# EasyEDA Pro project C8T6v1.eprj, schematic Schematic1
Board Name: PCB2; Create Date: 2026-07-18; Page Name: P1; Project Name: 12; Schematic Name: Schematic1; Update Date: 2026-07-18; Company: 嘉立创EDA; Page Size: A4; Version: V1.0
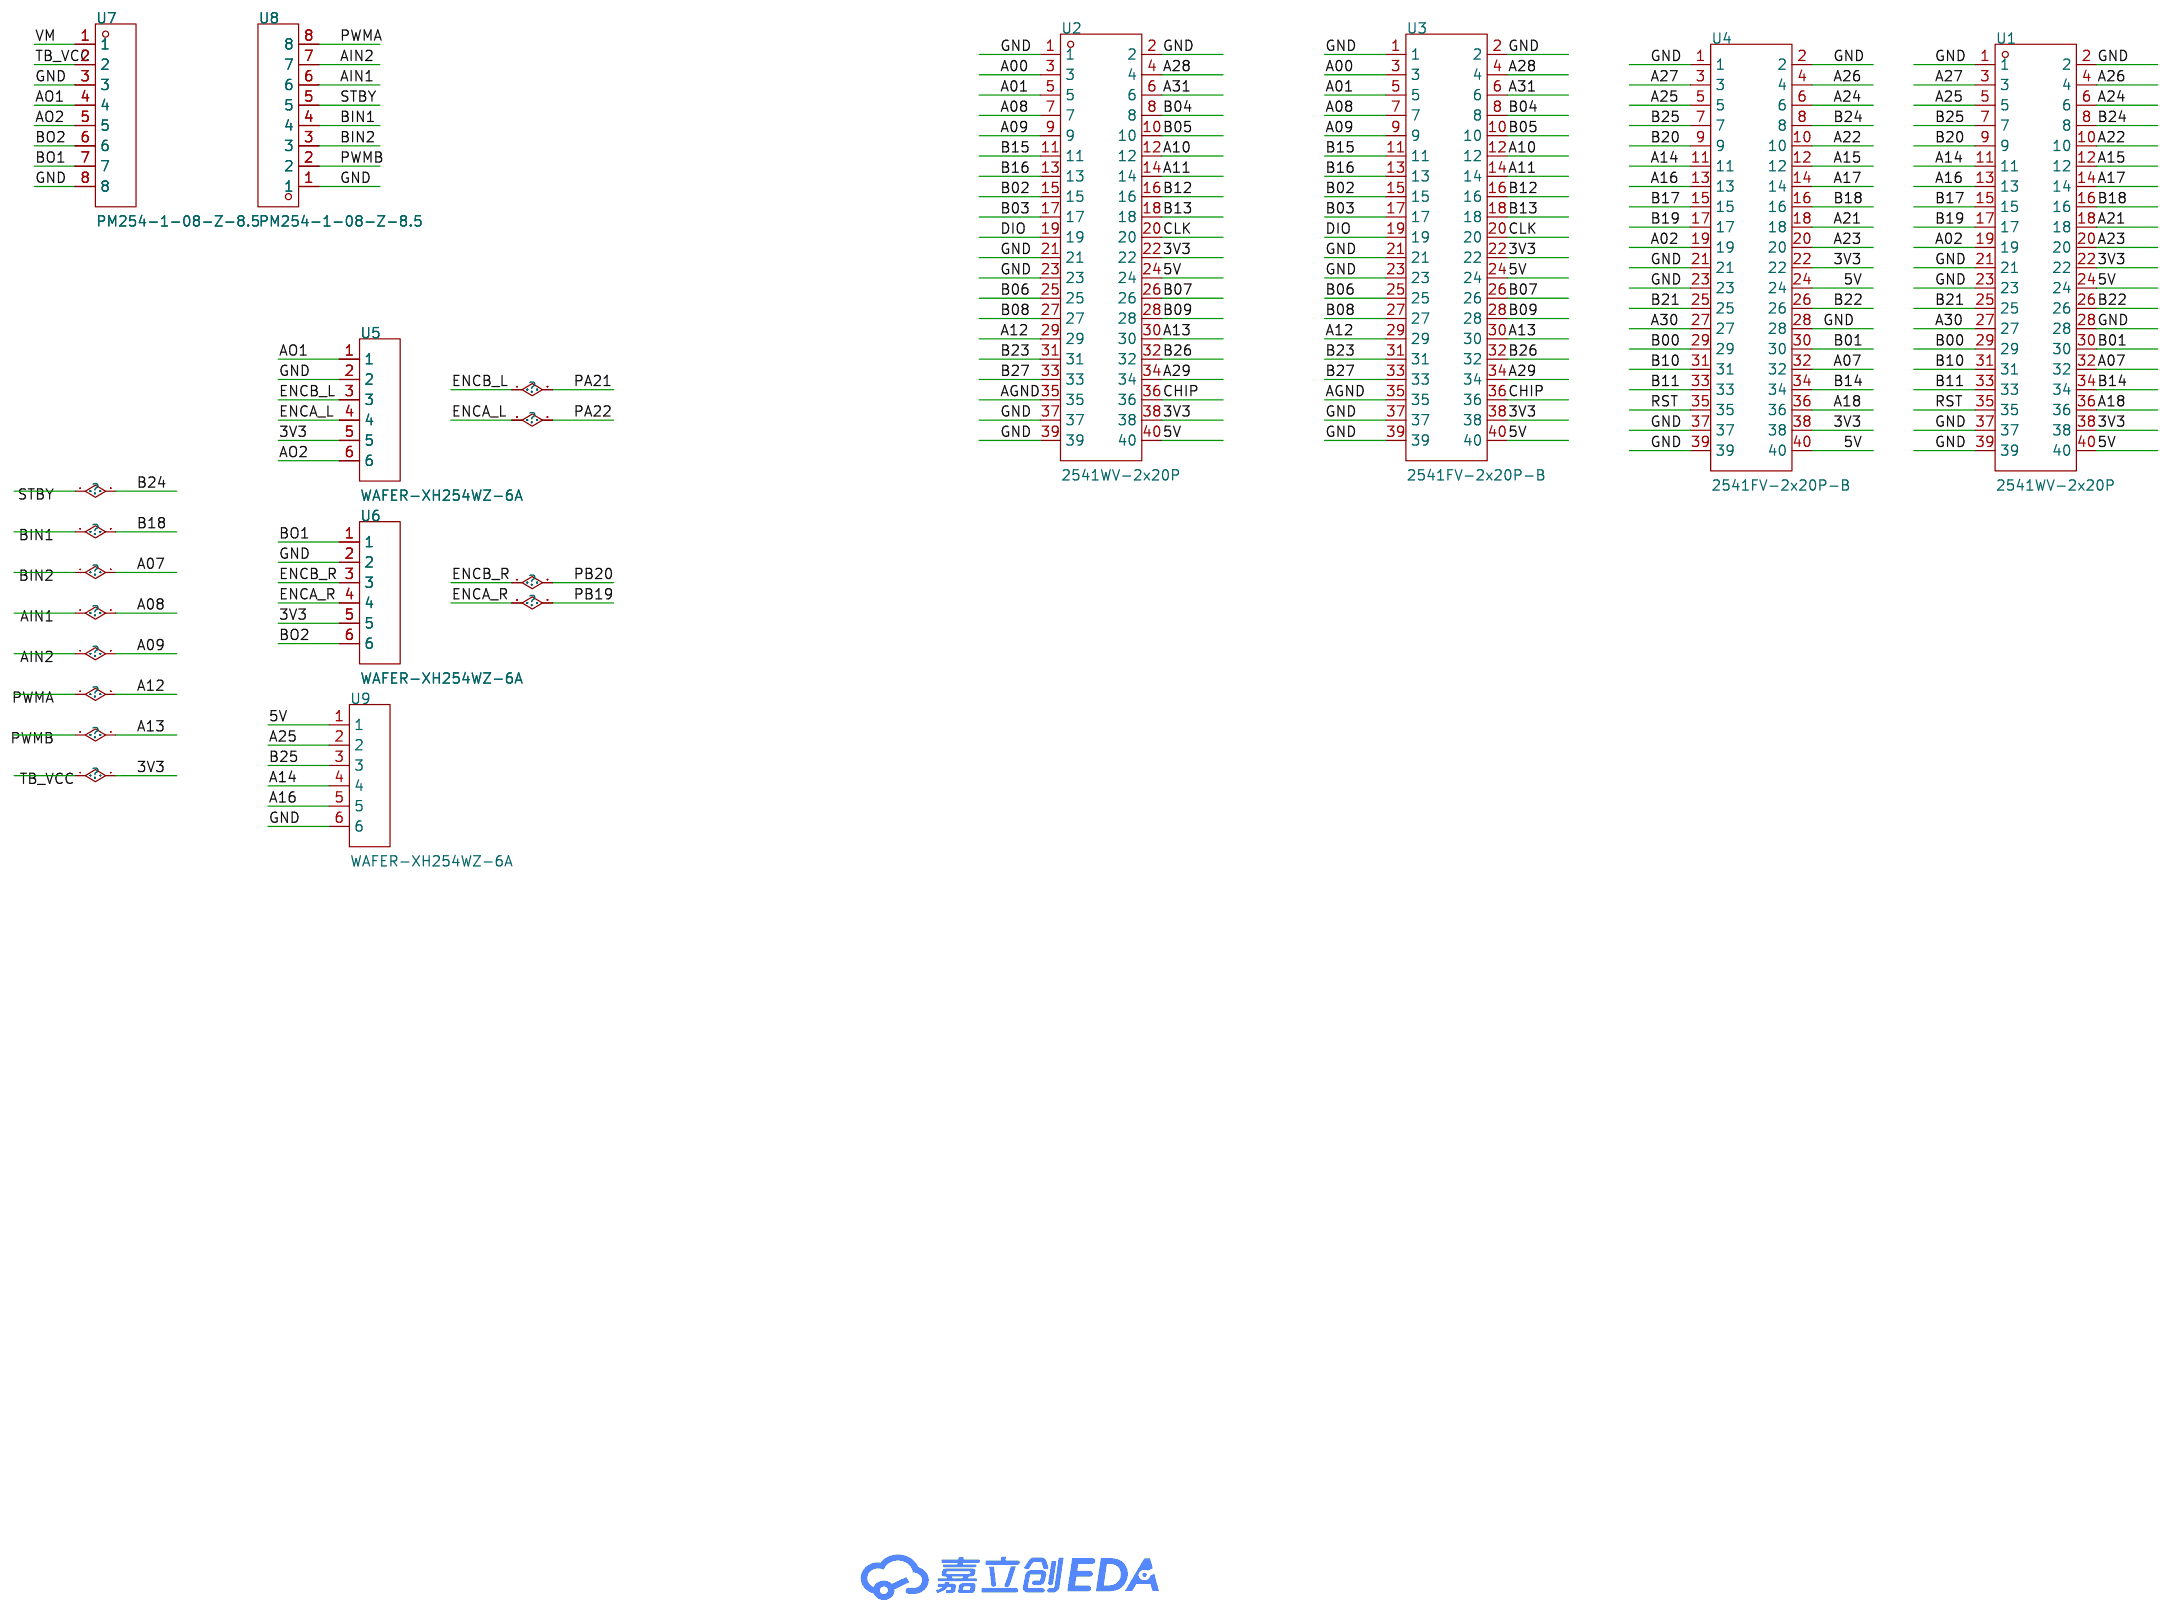
[diagram p0: schematic sheet]

## Parts
U1  2541WV-2x20P  [HDR-TH_40P-P2.54-V-M-R2-C20-S2.54]
U2  2541WV-2x20P  [HDR-TH_40P-P2.54-V-M-R2-C20-S2.54]
U3  2541FV-2x20P-B  [HDR-TH_40P-P2.54-V-F-R2-C20-S2.54]
U4  2541FV-2x20P-B  [HDR-TH_40P-P2.54-V-F-R2-C20-S2.54]
U5  WAFER-XH254WZ-6A  [CONN-TH_6P-P2.50_WAFER-XH254WZ-6A]
U6  WAFER-XH254WZ-6A  [CONN-TH_6P-P2.50_WAFER-XH254WZ-6A]
U7  PM254-1-08-Z-8.5  [HDR-TH_8P-P2.54-V-F]
U8  PM254-1-08-Z-8.5  [HDR-TH_8P-P2.54-V-F]
U9  WAFER-XH254WZ-6A  [CONN-TH_6P-P2.50_WAFER-XH254WZ-6A]

## Library data of the parts
U1 U2 = 2541WV-2x20P: LCSC Part Name: 2x20P 间距:2.54mm 方针 直插; Supplier Part: C25503140; Manufacturer: HanElectricity(瀚源); Supplier Footprint: 插件,P=2.54mm; JLCPCB Part Class: 扩展库; Datasheet: https://item.szlcsc.com/datasheet/2541WV-2x20P/27233683.html; Supplier: LCSC; Pin Structure: 2x20P; Pitch: 2.54mm; Row Spacing: 2.54mm; Circluar Pins/Square Pins: 方针; Mounting Type: 直插; Number of Rows: 双排; Number of Pins: 40P; Current Rating: 3A; Length of Mating Pin: 6mm; Insulation Height: 2.54mm; Length of End Connection Pin: 3mm; Contact Material: 黄铜; Contact Plating: 金; Operating Temperature: -55℃~+105℃
U3 U4 = 2541FV-2x20P-B: LCSC Part Name: 2x20P 间距:2.54mm 直插; Supplier Part: C25503128; Manufacturer: HanElectricity(瀚源); Supplier Footprint: 插件,P=2.54mm; JLCPCB Part Class: 扩展库; Datasheet: https://item.szlcsc.com/datasheet/2541FV-2x20P-B/27233671.html; Supplier: LCSC; Holes Structure: 2x20P; Pitch: 2.54mm; Row Spacing: 2.54mm; Circular Hole / Square Hole: 方孔; Mounting Type: 直插; Number of Rows: 双排; Number of Positions: 40P; Current Rating: 3A; Holes Direction: 顶部; Operating Temperature: -40℃~+105℃
U5 U6 U9 = WAFER-XH254WZ-6A: LCSC Part Name: 1x6P 间距:2.54mm 弯插 系列:XH; Supplier Part: C7432695; Manufacturer: HANBO(汉博); Supplier Footprint: 插件,P=2.5mm; JLCPCB Part Class: 扩展库; Datasheet: https://item.szlcsc.com/datasheet/WAFER-XH254WZ-6A/8437692.html; Supplier: LCSC; Pins Structure: 1x6P; Pitch: 2.54mm; Mounting Type: 弯插; Reference Series: XH; Number of Pins: 6P; Number of Rows: 1; Number of PINs Per Row: 6; Current Rating: 3A; Contact Material: 黄铜; Operating Temperature: -25℃~+85℃; Voltage Rating: 250V; Plastic Material: PA66; Flame Retardant Rating: UL94V-0
U7 U8 = PM254-1-08-Z-8.5: LCSC Part Name: 1x8P 间距:2.54mm 直插; Supplier Part: C2897371; Manufacturer: HCTL(华灿天禄); Supplier Footprint: 插件,P=2.54mm; JLCPCB Part Class: 扩展库; Datasheet: https://item.szlcsc.com/datasheet/PM254-1-08-Z-8.5/3142376.html; Supplier: LCSC; Holes Structure: 1x8P; Pitch: 2.54mm; Circular Hole / Square Hole: 方孔; Mounting Type: 直插; Number of Rows: 单排; Number of Positions: 8P; Current Rating: 3A; Holes Direction: 顶部; Insulation Height: 8.5mm; Contact Material: 铜合金; Operating Temperature: -40℃~+105℃

## Nets
3V3: U1.22 U1.38 U2.22 U2.38 U3.22 U3.38 U4.22 U4.38 U5.5 U6.5 U7.2
5V: U1.24 U1.40 U2.24 U2.40 U3.24 U3.40 U4.24 U4.40 U9.1
AGND: U2.35 U3.35
GND: U1.1 U1.2 U1.21 U1.23 U1.28 U1.37 U1.39 U2.1 U2.2 U2.21 U2.23 U2.37 U2.39 U3.1 U3.2 U3.21 U3.23 U3.37 U3.39 U4.1 U4.2 U4.21 U4.23 U4.28 U4.37 U4.39 U5.2 U6.2 U7.3 U7.8 U8.1 U9.6
A00: U2.3 U3.3
A01: U2.5 U3.5
A02: U1.19 U4.19
A07: U1.32 U4.32 U8.3
A08: U2.7 U3.7 U8.6
A09: U2.9 U3.9 U8.7
A10: U2.12 U3.12
A11: U2.14 U3.14
A12: U2.29 U3.29 U8.8
A13: U2.30 U3.30 U8.2
A14: U1.11 U4.11 U9.4
A15: U1.12 U4.12
A16: U1.13 U4.13 U9.5
A17: U1.14 U4.14
A18: U1.36 U4.36
A21: U1.18 U4.18
A22: U1.10 U4.10
A23: U1.20 U4.20
A24: U1.6 U4.6
A25: U1.5 U4.5 U9.2
A26: U1.4 U4.4
A27: U1.3 U4.3
A28: U2.4 U3.4
A29: U2.34 U3.34
A30: U1.27 U4.27
A31: U2.6 U3.6
AO1: U5.1 U7.4
AO2: U5.6 U7.5
B00: U1.29 U4.29
B01: U1.30 U4.30
B02: U2.15 U3.15
B03: U2.17 U3.17
B04: U2.8 U3.8
B05: U2.10 U3.10
B06: U2.25 U3.25
B07: U2.26 U3.26
B08: U2.27 U3.27
B09: U2.28 U3.28
B10: U1.31 U4.31
B11: U1.33 U4.33
B12: U2.16 U3.16
B13: U2.18 U3.18
B14: U1.34 U4.34
B15: U2.11 U3.11
B16: U2.13 U3.13
B17: U1.15 U4.15
B18: U1.16 U4.16 U8.4
B19: U1.17 U4.17
B20: U1.9 U4.9
B21: U1.25 U4.25
B22: U1.26 U4.26
B23: U2.31 U3.31
B24: U1.8 U4.8 U8.5
B25: U1.7 U4.7 U9.3
B26: U2.32 U3.32
B27: U2.33 U3.33
BO1: U6.1 U7.7
BO2: U6.6 U7.6
CHIP: U2.36 U3.36
CLK: U2.20 U3.20
DIO: U2.19 U3.19
ENCA_L: U5.4
ENCA_R: U6.4
ENCB_L: U5.3
ENCB_R: U6.3
RST: U1.35 U4.35
VM: U7.1
